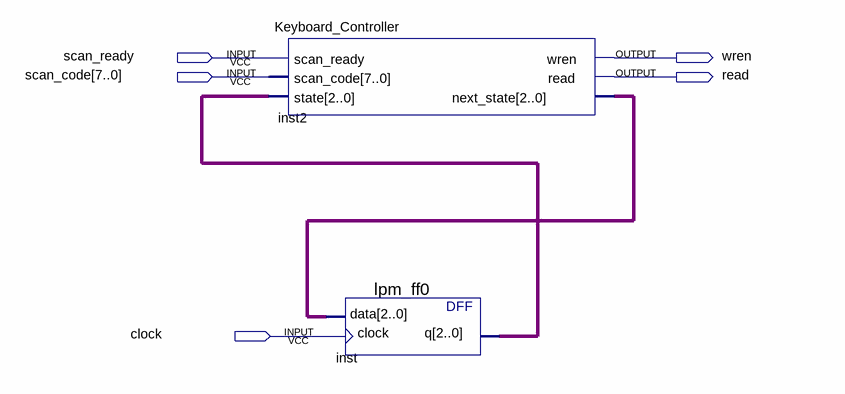
[diagram p0: schematic sheet]
// Quartus schematic keyboard_processor.bdf as structural Verilog: 2 symbols, 5 pins
module keyboard_processor (
  input  scan_ready,
  input  [7:0] scan_code,
  input  clock,
  output wren,
  output read
);

  wire [2:0] inst2_next_state, inst_q;

  Keyboard_Controller inst2 (
    .scan_ready(scan_ready), .scan_code(scan_code), .state(inst_q), .wren(wren), .read(read),
    .next_state(inst2_next_state));
  lpm_ff0 inst (.data(inst2_next_state), .clock(clock), .q(inst_q));
endmodule
